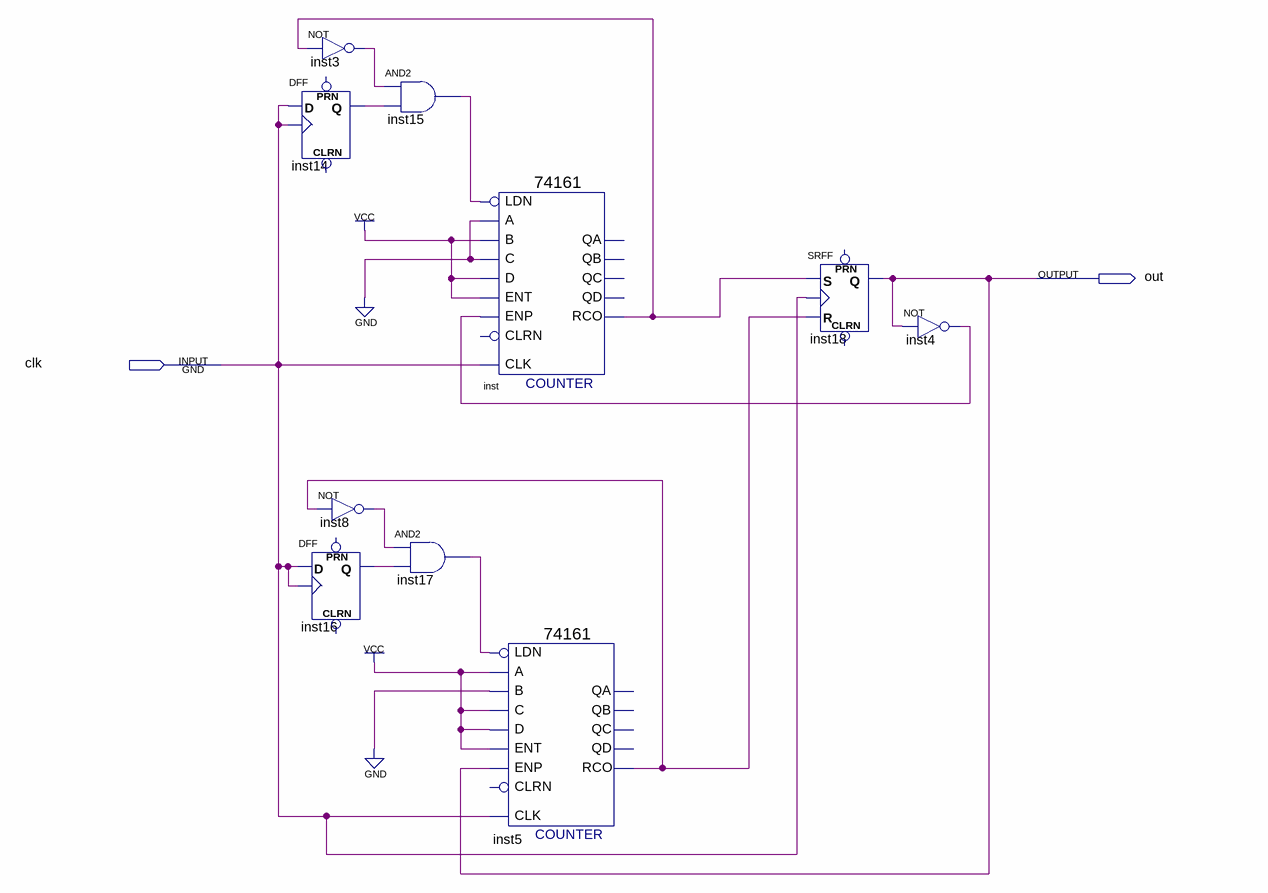
[diagram p0: schematic sheet]
// Quartus schematic block_1.bdf as structural Verilog: 10 symbols, 2 pins
module block_1 (
  input  clk,
  output out
);

  wire inst3_out, inst4_out, inst5_rco, inst8_out, inst14_q, inst15_out, inst16_q, inst17_out, inst_rco;

  not inst3 (inst3_out, inst_rco);
  DFF inst14 (.CLK(clk), .D(clk), .Q(inst14_q));  // open: CLRN, PRN
  not inst8 (inst8_out, inst5_rco);
  DFF inst16 (.CLK(clk), .D(clk), .Q(inst16_q));  // open: CLRN, PRN
  and inst15 (inst15_out, inst3_out, inst14_q);
  and inst17 (inst17_out, inst8_out, inst16_q);
  \74161  inst (
    .CLK(clk), .ENP(inst4_out), .LDN(inst15_out), .A(1'b0), .D(1'b1), .ENT(1'b1), .B(1'b1), .C(1'b0),
    .RCO(inst_rco));  // open: CLRN, QD, QC, QB, QA
  \74161  inst5 (
    .CLK(clk), .ENP(out), .LDN(inst17_out), .A(1'b1), .D(1'b1), .ENT(1'b1), .B(1'b0), .C(1'b1),
    .RCO(inst5_rco));  // open: CLRN, QD, QC, QB, QA
  SRFF inst18 (.S(inst_rco), .R(inst5_rco), .CLK(clk), .Q(out));  // open: PRN, CLRN
  not inst4 (inst4_out, out);
endmodule
